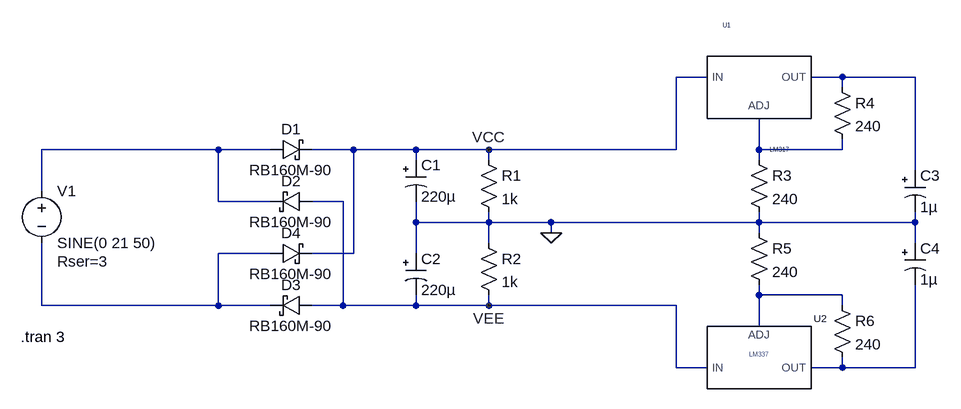
[diagram p0: schematic dual_rail.asc]
dual_rail.asc, the LTspice schematic file:
Version 4
SHEET 1 1736 680
WIRE 1088 -48 1040 -48
WIRE 1296 -48 1248 -48
WIRE 1408 -48 1296 -48
WIRE 1296 -32 1296 -48
WIRE 336 64 64 64
WIRE 416 64 336 64
WIRE 544 64 480 64
WIRE 640 64 544 64
WIRE 752 64 640 64
WIRE 1040 64 1040 -48
WIRE 1040 64 752 64
WIRE 1168 64 1168 16
WIRE 1296 64 1296 48
WIRE 1296 64 1168 64
WIRE 640 80 640 64
WIRE 752 80 752 64
WIRE 1168 80 1168 64
WIRE 1408 96 1408 -48
WIRE 64 128 64 64
WIRE 336 144 336 64
WIRE 416 144 336 144
WIRE 528 144 480 144
WIRE 640 176 640 144
WIRE 752 176 752 160
WIRE 752 176 640 176
WIRE 848 176 752 176
WIRE 1168 176 1168 160
WIRE 1168 176 848 176
WIRE 1408 176 1408 160
WIRE 1408 176 1168 176
WIRE 848 192 848 176
WIRE 1168 192 1168 176
WIRE 752 208 752 176
WIRE 1408 208 1408 176
WIRE 416 224 336 224
WIRE 544 224 544 64
WIRE 544 224 480 224
WIRE 640 224 640 176
WIRE 1168 288 1168 272
WIRE 1296 288 1168 288
WIRE 64 304 64 208
WIRE 336 304 336 224
WIRE 336 304 64 304
WIRE 416 304 336 304
WIRE 528 304 528 144
WIRE 528 304 480 304
WIRE 640 304 640 288
WIRE 640 304 528 304
WIRE 752 304 752 288
WIRE 752 304 640 304
WIRE 1040 304 752 304
WIRE 1296 304 1296 288
WIRE 1168 336 1168 288
WIRE 1040 400 1040 304
WIRE 1088 400 1040 400
WIRE 1296 400 1296 384
WIRE 1296 400 1248 400
WIRE 1408 400 1408 272
WIRE 1408 400 1296 400
FLAG 848 192 0
FLAG 752 64 VCC
FLAG 752 304 VEE
SYMBOL voltage 64 112 R0
WINDOW 123 0 0 Left 0
WINDOW 39 24 124 Left 2
SYMATTR SpiceLine Rser=3
SYMATTR InstName V1
SYMATTR Value SINE(0 21 50)
SYMBOL schottky 416 80 R270
WINDOW 0 32 32 VTop 2
WINDOW 3 0 32 VBottom 2
SYMATTR InstName D1
SYMATTR Value RB160M-90
SYMATTR Description Diode
SYMATTR Type diode
SYMBOL schottky 480 128 R90
WINDOW 0 0 32 VBottom 2
WINDOW 3 32 32 VTop 2
SYMATTR InstName D2
SYMATTR Value RB160M-90
SYMATTR Description Diode
SYMATTR Type diode
SYMBOL schottky 480 288 R90
WINDOW 0 0 32 VBottom 2
WINDOW 3 32 32 VTop 2
SYMATTR InstName D3
SYMATTR Value RB160M-90
SYMATTR Description Diode
SYMATTR Type diode
SYMBOL schottky 416 240 R270
WINDOW 0 32 32 VTop 2
WINDOW 3 0 32 VBottom 2
SYMATTR InstName D4
SYMATTR Value RB160M-90
SYMATTR Description Diode
SYMATTR Type diode
SYMBOL polcap 624 80 R0
WINDOW 3 24 56 Left 2
SYMATTR Value 220µ
SYMATTR InstName C1
SYMATTR Description Capacitor
SYMATTR Type cap
SYMATTR SpiceLine V=50 Irms=400m Rser=0.21 Lser=0 mfg="Nichicon" pn="UPR1H221MPH" type="Al electrolytic"
SYMBOL polcap 624 224 R0
WINDOW 3 24 56 Left 2
SYMATTR Value 220µ
SYMATTR InstName C2
SYMATTR Description Capacitor
SYMATTR Type cap
SYMATTR SpiceLine V=50 Irms=400m Rser=0.21 Lser=0 mfg="Nichicon" pn="UPR1H221MPH" type="Al electrolytic"
SYMBOL res 736 64 R0
SYMATTR InstName R1
SYMATTR Value 1k
SYMBOL res 736 192 R0
SYMATTR InstName R2
SYMATTR Value 1k
SYMBOL LM317 1168 -48 R0
WINDOW 0 -56 -80 Left 0
WINDOW 3 16 112 Left 0
SYMATTR InstName U1
SYMBOL polcap 1392 96 R0
WINDOW 3 24 56 Left 2
SYMATTR Value 1µ
SYMATTR InstName C3
SYMATTR Description Capacitor
SYMATTR Type cap
SYMATTR SpiceLine V=50 Irms=6.2m Rser=2.668 Lser=852p mfg="Würth Elektronik" pn="865230640005 WCAP-AS5H 4x5,5" type="Al electrolytic"
SYMBOL res 1152 64 R0
SYMATTR InstName R3
SYMATTR Value 240
SYMBOL res 1280 -48 R0
SYMATTR InstName R4
SYMATTR Value 240
SYMBOL LM337 1168 384 R0
SYMATTR InstName U2
SYMBOL res 1152 176 R0
SYMATTR InstName R5
SYMATTR Value 240
SYMBOL res 1280 288 R0
SYMATTR InstName R6
SYMATTR Value 240
SYMBOL polcap 1392 208 R0
WINDOW 3 24 56 Left 2
SYMATTR Value 1µ
SYMATTR InstName C4
SYMATTR Description Capacitor
SYMATTR Type cap
SYMATTR SpiceLine V=50 Irms=6.2m Rser=2.668 Lser=852p mfg="Würth Elektronik" pn="865230640005 WCAP-AS5H 4x5,5" type="Al electrolytic"
TEXT 32 352 Left 2 !.tran 3

The netlist it stands for:
* dual_rail.asc
V1 N002 N004 SINE(0 21 50) Rser=3
D1 N002 VCC RB160M-90
D2 VEE N002 RB160M-90
D3 VEE N004 RB160M-90
D4 N004 VCC RB160M-90
C1 VCC 0 220µ V=50 Irms=400m Rser=0.21 Lser=0 mfg="Nichicon" pn="UPR1H221MPH" type="Al electrolytic"
C2 0 VEE 220µ V=50 Irms=400m Rser=0.21 Lser=0 mfg="Nichicon" pn="UPR1H221MPH" type="Al electrolytic"
R1 VCC 0 1k
R2 0 VEE 1k
XU1 VCC N003 N001 LM317  ; pins IN ADJ OUT
C3 N001 0 1µ V=50 Irms=6.2m Rser=2.668 Lser=852p mfg="Würth Elektronik" pn="865230640005 WCAP-AS5H 4x5,5" type="Al electrolytic"
R3 N003 0 240
R4 N001 N003 240
XU2 VEE N005 N006 Lm337 Lm337  ; pins IN ADJ OUT
R5 0 N005 240
R6 N005 N006 240
C4 0 N006 1µ V=50 Irms=6.2m Rser=2.668 Lser=852p mfg="Würth Elektronik" pn="865230640005 WCAP-AS5H 4x5,5" type="Al electrolytic"
.model D D
.lib standard.dio
.tran 3
.lib lm317.lib
.lib LM337.lib
.backanno
.end